# Altium schematic sheet Ethernet.SchDoc
size A4; SheetNumber: 7; SheetTotal: 7
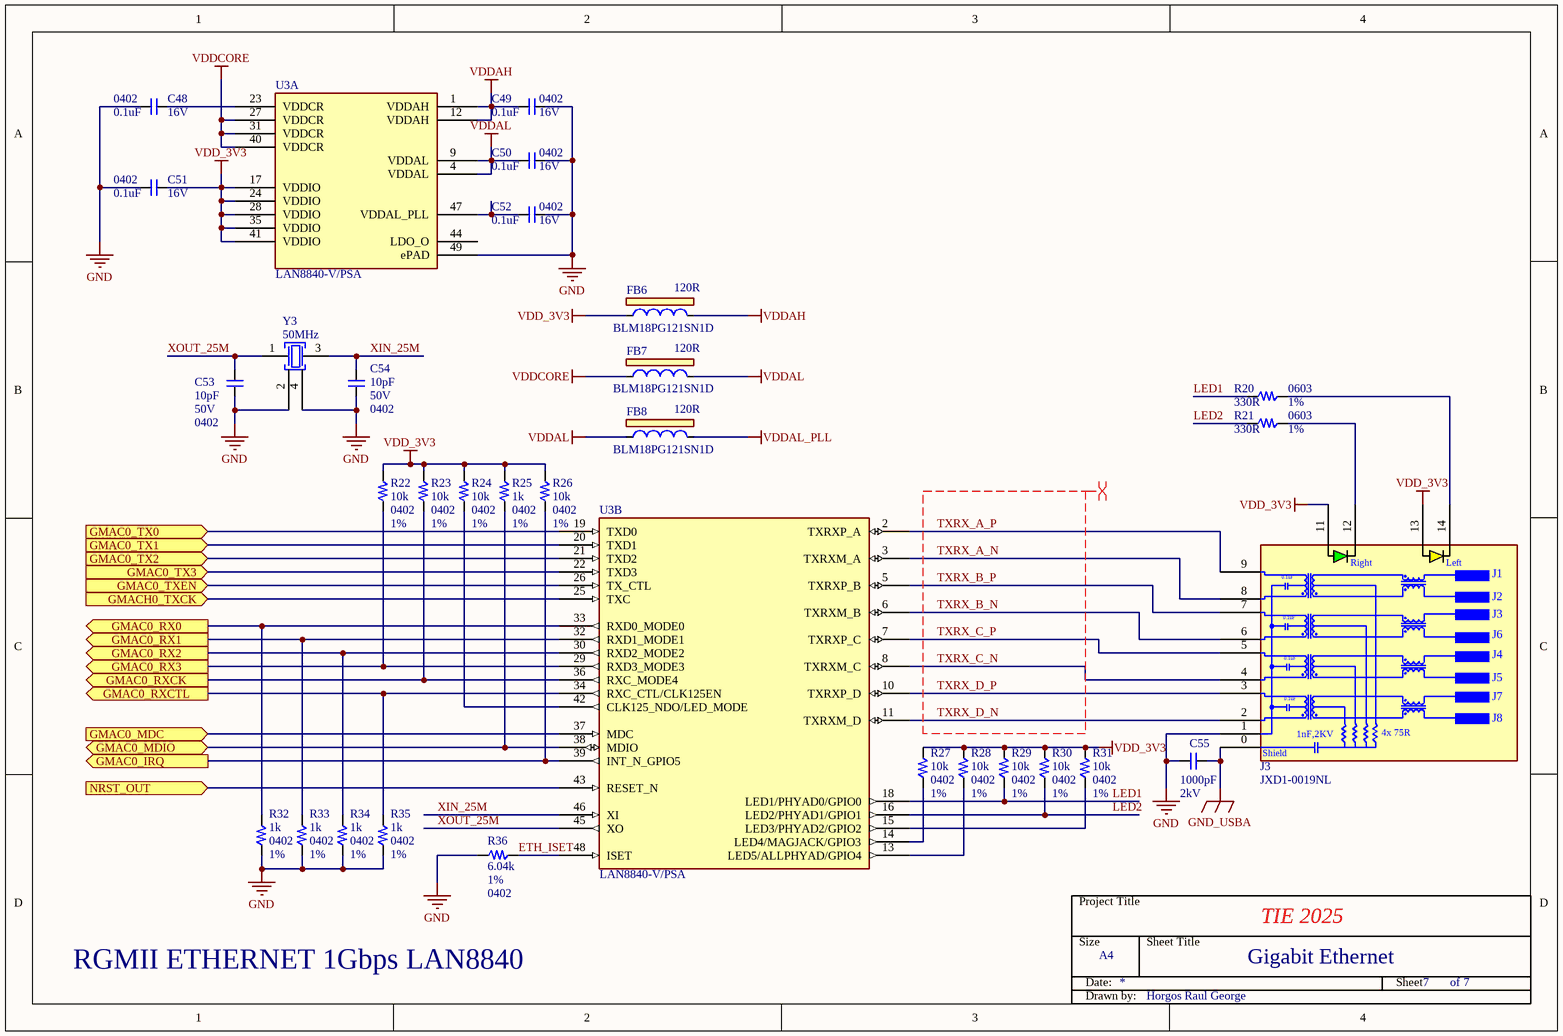
[diagram p0: Ethernet.SchDoc]

## Parts
C48  0.1uF  Rated Voltage: 16V  Package: 0402  [CAP0402]
C49  0.1uF  Rated Voltage: 16V  Package: 0402  [CAP0402]
C50  0.1uF  Rated Voltage: 16V  Package: 0402  [CAP0402]
C51  0.1uF  Rated Voltage: 16V  Package: 0402  [CAP0402]
C52  0.1uF  Rated Voltage: 16V  Package: 0402  [CAP0402]
C53  10pF  Rated Voltage: 50V  Package: 0402  [CAP0402]
C54  10pF  Rated Voltage: 50V  Package: 0402  [CAP0402]
C55  1000pF  Rated Voltage: 2kV  [CAP1206]
FB6  120R  [FB0603]
FB7  120R  [FB0603]
FB8  120R  [FB0603]
J3  JXD1-0019NL  [JXD1-0019NL]
R20  330R  Tolerance: 1%  Package: 0603  [RES0603]
R21  330R  Tolerance: 1%  Package: 0603  [RES0603]
R22  10k  Tolerance: 1%  Package: 0402  [RES0402]
R23  10k  Tolerance: 1%  Package: 0402  [RES0402]
R24  10k  Tolerance: 1%  Package: 0402  [RES0402]
R25  1k  Tolerance: 1%  Package: 0402  [RES0402]
R26  10k  Tolerance: 1%  Package: 0402  [RES0402]
R27  10k  Tolerance: 1%  Package: 0402  [RES0402]
R28  10k  Tolerance: 1%  Package: 0402  [RES0402]
R29  10k  Tolerance: 1%  Package: 0402  [RES0402]
R30  10k  Tolerance: 1%  Package: 0402  [RES0402]
R31  10k  Tolerance: 1%  Package: 0402  [RES0402]
R32  1k  Tolerance: 1%  Package: 0402  [RES0402]
R33  1k  Tolerance: 1%  Package: 0402  [RES0402]
R34  1k  Tolerance: 1%  Package: 0402  [RES0402]
R35  1k  Tolerance: 1%  Package: 0402  [RES0402]
R36  6.04k  Tolerance: 1%  Package: 0402  [RES0402]
Title_7  Title Block  (value not drawn)  (graphical)
U3  LAN8840-V/PSA  [QFN-48]  (parts A,B of 2)
Y3  50MHz  [VXM7-1362-50M0000000]

## Ports
GMAC0_IRQ (out, see MPU-PIO[4B]), GMAC0_MDC (in, see MPU-PIO[1B]), GMAC0_MDIO (bidir, see MPU-PIO[1B]), GMAC0_RX0 (out, see MPU-PIO[1B]), GMAC0_RX1 (out, see MPU-PIO[1B]), GMAC0_RX2 (out, see MPU-PIO[1B]), GMAC0_RX3 (out, see MPU-PIO[1B]), GMAC0_RXCK (out, see MPU-PIO[1B]), GMAC0_RXCTL (out, see MPU-PIO[1B]), GMAC0_TX0 (in, see MPU-PIO[1B]), GMAC0_TX1 (in, see MPU-PIO[1B]), GMAC0_TX2 (in, see MPU-PIO[1B]), GMAC0_TX3 (in, see MPU-PIO[1B]), GMAC0_TXEN (in, see MPU-PIO[1B]), GMACH0_TXCK (in, see MPU-PIO[1B]), NRST_OUT (in, see MPU-System[1A])

## Nets
GND: C48.1 C49.2 C50.2 C51.1 C52.2 C53.1 C54.2 C55.1 J3.1 R32.1 R33.1 R34.1 R35.1 R36.1 U3.49(ePAD) Y3.2 Y3.4
GND_USBA: C55.2 J3.0
VDD_3V3: C51.2 FB6.1 J3.11 J3.13 R22.2 R23.2 R24.2 R25.2 R26.2 R27.2 R28.2 R29.2 R30.2 R31.2 U3.17(VDDIO) U3.24(VDDIO) U3.28(VDDIO) U3.35(VDDIO) U3.41(VDDIO)
VDDAH: C49.1 FB6.2 U3.1(VDDAH) U3.12(VDDAH)
VDDAL: C50.1 FB7.2 FB8.1 U3.4(VDDAL) U3.9(VDDAL)
VDDAL_PLL: FB8.2
VDDCORE: FB7.1 U3.27(VDDCR) U3.31(VDDCR) U3.40(VDDCR)
ETH_ISET: R36.2 U3.48(ISET)
GMAC0_IRQ: R26.1 U3.39(INT_N_GPIO5) ; port GMAC0_IRQ
GMAC0_MDC: U3.37(MDC) ; port GMAC0_MDC
GMAC0_MDIO: R25.1 U3.38(MDIO) ; port GMAC0_MDIO
GMAC0_RX0: R32.2 U3.33(RXD0_MODE0) ; port GMAC0_RX0
GMAC0_RX1: R33.2 U3.32(RXD1_MODE1) ; port GMAC0_RX1
GMAC0_RX2: R34.2 U3.30(RXD2_MODE2) ; port GMAC0_RX2
GMAC0_RX3: R22.1 U3.29(RXD3_MODE3) ; port GMAC0_RX3
GMAC0_RXCK: R23.1 U3.36(RXC_MODE4) ; port GMAC0_RXCK
GMAC0_RXCTL: R35.2 U3.34(RXC_CTL/CLK125EN) ; port GMAC0_RXCTL
GMAC0_TX0: U3.19(TXD0) ; port GMAC0_TX0
GMAC0_TX1: U3.20(TXD1) ; port GMAC0_TX1
GMAC0_TX2: U3.21(TXD2) ; port GMAC0_TX2
GMAC0_TX3: U3.22(TXD3) ; port GMAC0_TX3
GMAC0_TXEN: U3.26(TX_CTL) ; port GMAC0_TXEN
GMACH0_TXCK: U3.25(TXC) ; port GMACH0_TXCK
LED1: R20.1 R29.1 U3.18(LED1/PHYAD0/GPIO0)
LED2: R21.1 R30.1 U3.16(LED2/PHYAD1/GPIO1)
NRST_OUT: U3.43(RESET_N) ; port NRST_OUT
TXRX_A_N: J3.8 U3.3(TXRXM_A)
TXRX_A_P: J3.9 U3.2(TXRXP_A)
TXRX_B_N: J3.6 U3.6(TXRXM_B)
TXRX_B_P: J3.7 U3.5(TXRXP_B)
TXRX_C_N: J3.4 U3.8(TXRXM_C)
TXRX_C_P: J3.5 U3.7(TXRXP_C)
TXRX_D_N: J3.2 U3.11(TXRXM_D)
TXRX_D_P: J3.3 U3.10(TXRXP_D)
XIN_25M: C54.1 U3.46(XI) Y3.3
XOUT_25M: C53.2 U3.45(XO) Y3.1
NetC48_2: C48.2 U3.23(VDDCR)
NetC52_1: C52.1 U3.47(VDDAL_PLL)
NetJ3_12: J3.12 R21.2
NetJ3_14: J3.14 R20.2
NetR24_1: R24.1 U3.42(CLK125_NDO/LED_MODE)
NetR27_1: R27.1 U3.14(LED4/MAGJACK/GPIO3)
NetR28_1: R28.1 U3.13(LED5/ALLPHYAD/GPIO4)
NetR31_1: R31.1 U3.15(LED3/PHYAD2/GPIO2)

Not connected (* = marked no-connect by the designer): U3 44(LDO_O)

## Layout directives
differential pair: TXRX_A_N, TXRX_A_P, TXRX_B_N, TXRX_B_P, TXRX_C_N, TXRX_C_P, TXRX_D_N, TXRX_D_P

## Notes on the sheet
- RGMII ETHERNET 1Gbps LAN8840
- Gigabit Ethernet
- (in symbol JXD1-0019NL) Right; Left; 0.1uF; J1; J2; J6; J4; J5; J7; J8; 1nF,2KV; 4x 75R; Shield
- (in symbol Title Block) Project Title; TIE 2025; Size; Sheet Title; A4; Date:; Sheet; of; Drawn by:; Horgos Raul George

## Library data of the parts
C48-C52 = C0402C104K4RAC7867: CAP CER 0.1uF 16V 10% X7R SMD 0402; Manufacturer: KEMET; .Checked_PCB: AI; Manufacturer Part Number: C0402C104K4RAC7867; .Checked_SCH: AI; .Creator: AI
C53 C54 = QSCF500Q100J1GV001T: CAP CER 10pF 50V 5% C0G/NP0 SMD 0402; Manufacturer: Johanson Technology; .Checked_PCB: AI; Manufacturer Part Number: QSCF500Q100J1GV001T; .Checked_SCH: AI; .Creator: AI
C55 = 202R18W102KV4E: CAP CER 1000pF 2KV 10% X7R SMD 1206; Manufacturer: D3_Johanson Dielectrics Inc; .Checked_PCB: AI; Manufacturer Part Number: 202R18W102KV4E; .Checked_SCH: AI; .Creator: AI
FB6-FB8 = BLM18PG121SN1D: FERRITE BEAD 120 OHM 0603 1LN; Manufacturer: Murata; .Checked_PCB: AI; .Checked_SCH: AI; .Creator: AI; Manufacturer Part Number: BLM18PG121SN1D
J3 = JXD1-0019NL: CON MODULAR JACK RJ45 10/100/1000 MAGNETICS 2xLEDs / SHIELD TH R/A; Manufacturer: Pulse Electronics; Manufacturer Part Number: JXD1-0019NL
R20 R21 = ERJ-3EKF3300V: RES TKF 330R 1% 1/10W SMD 0603; Manufacturer: Panasonic; .Checked_PCB: IC; Manufacturer Part Number: ERJ-3EKF3300V; .Checked_SCH: IC; .Creator: IC
R22-R24 R26-R31 = ERJ-2RKF1002X: RES TKF 10k 1% 1/10W SMD 0402; Manufacturer: Panasonic; Manufacturer Part Number: ERJ-2RKF1002X
R25 R32-R35 = ERJ-2RKF1001X: RES TKF 1k 1% 1/10W SMD 0402; Manufacturer: Panasonic; Manufacturer Part Number: ERJ-2RKF1001X
R36 = ERJ-2RKF6041X: RES TKF 6.04k 1% 1/10W SMD 0402 AEC-Q200; Manufacturer: Panasonic Electronic; Manufacturer Part Number: ERJ-2RKF6041X
U3 = LAN8840-V/PSA: MCHP INTERFACE ETHERNET LAN8840 QFN-48; Manufacturer: Microchip Technology; Manufacturer Part Number: LAN8840-V/PSA
Y3 = VXM7-1362-50M0000000: MCHP CRYSTAL 50MHz VXM7-1362-50M0000000 SMD / L3.2W2.5H0.8; Manufacturer: Microchip Technology; Manufacturer Part Number: VXM7-1362-50M0000000